# Altium schematic sheet 10_POWER_INPUT.SchDoc
size 297 x 209 mm
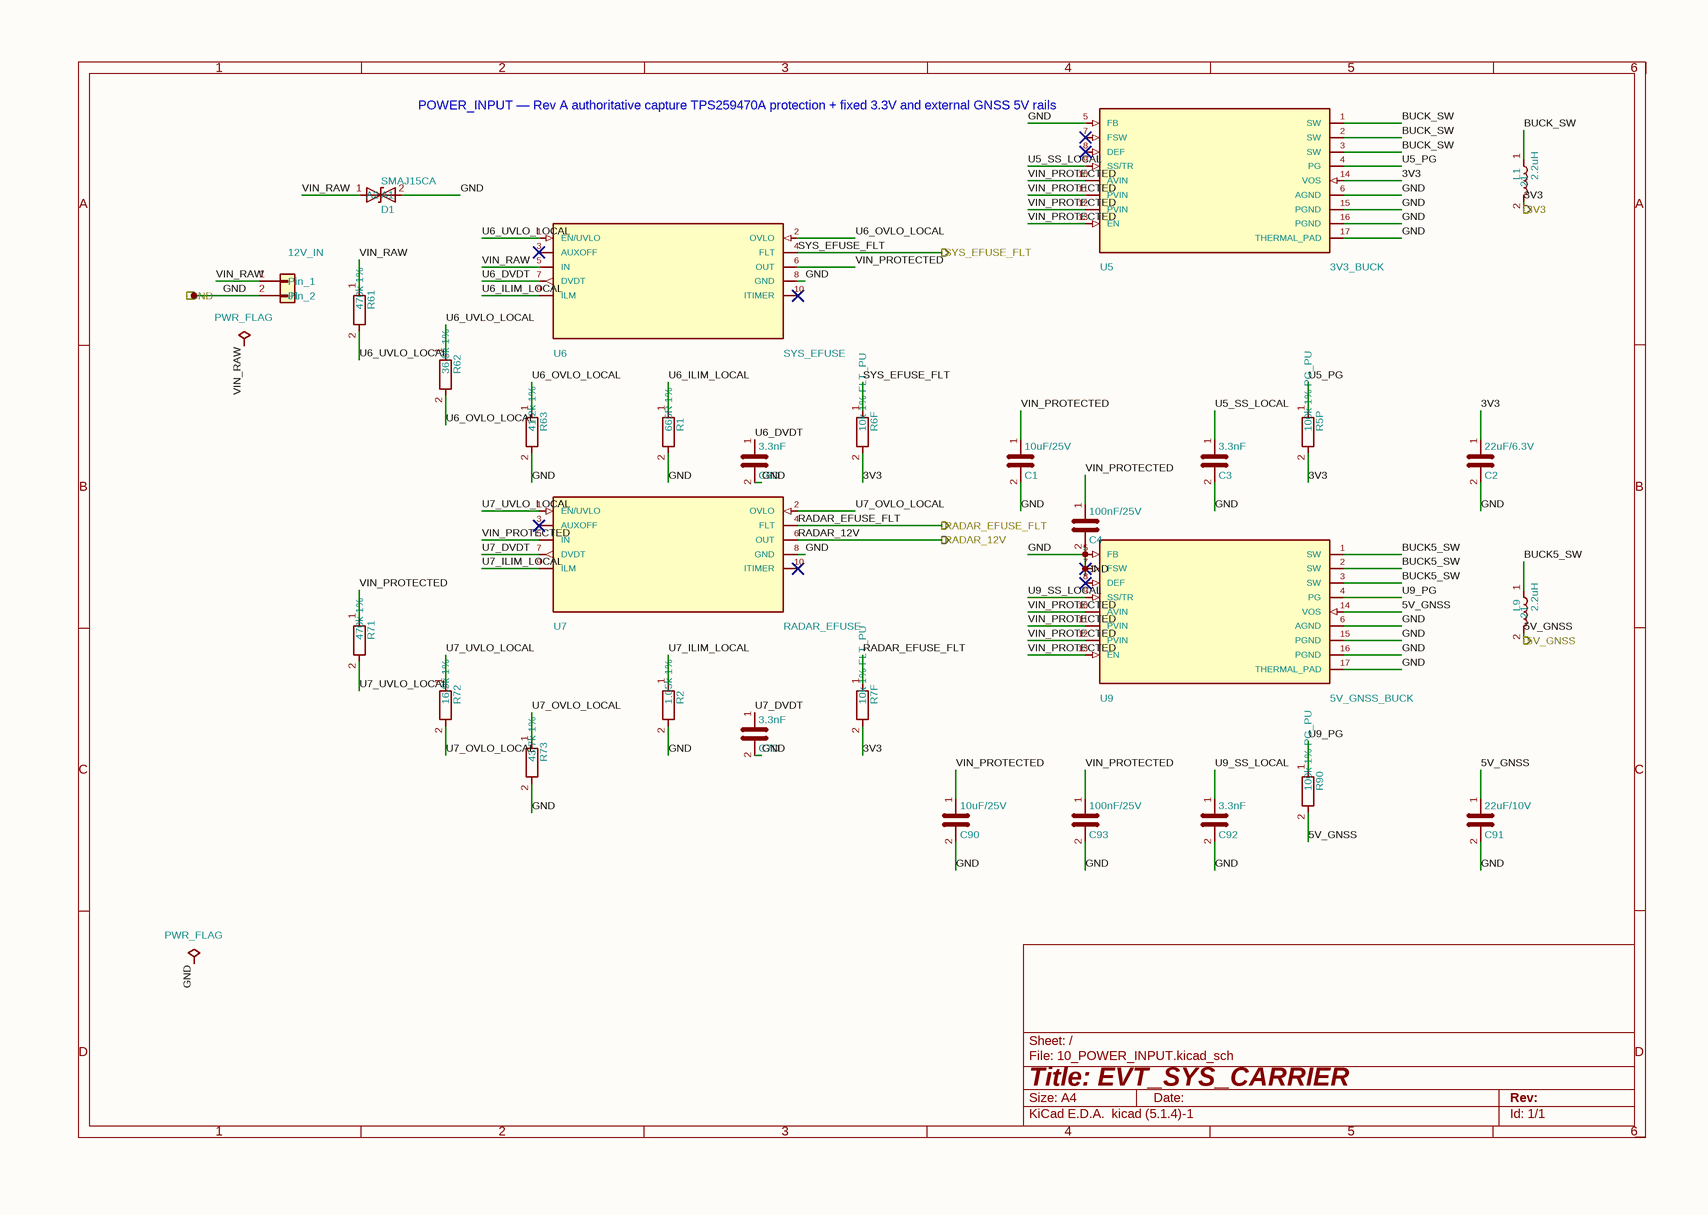
[diagram p0: 10_POWER_INPUT.SchDoc]

## Parts
#FLG0201  PWR_FLAG  (graphical)
#FLG0202  PWR_FLAG  (graphical)
C1  10uF/25V  [C_1206_3216Metric]
C2  22uF/6.3V  [C_1206_3216Metric]
C3  3.3nF  [C_0603_1608Metric]
C4  100nF/25V  [C_0603_1608Metric]
C6D  3.3nF  [C_0603_1608Metric]
C7D  3.3nF  [C_0603_1608Metric]
C90  10uF/25V  [C_1206_3216Metric]
C91  22uF/10V  [C_1206_3216Metric]
C92  3.3nF  [C_0603_1608Metric]
C93  100nF/25V  [C_0603_1608Metric]
D1  SMAJ15CA  [D_SMA]
J1  12V_IN  [Molex_43650-0200_RA_THT_2P]
L1  2.2uH  [Coilcraft_XFL4020_4x4]
L9  2.2uH  [Coilcraft_XFL4020_4x4]
R1  665R 1%  [R_0603_1608Metric]
R2  1.05k 1%  [R_0603_1608Metric]
R5P  100k 1% PG_PU  [R_0603_1608Metric]
R6F  10k 1% FLT_PU  [R_0603_1608Metric]
R7F  10k 1% FLT_PU  [R_0603_1608Metric]
R61  470k 1%  [R_0603_1608Metric]
R62  36.0k 1%  [R_0603_1608Metric]
R63  41.2k 1%  [R_0603_1608Metric]
R71  470k 1%  [R_0603_1608Metric]
R72  16.9k 1%  [R_0603_1608Metric]
R73  43.7k 1%  [R_0603_1608Metric]
R90  100k 1% PG_PU  [R_0603_1608Metric]
U5  3V3_BUCK  [VQFN-16-1EP_3x3mm_P0.5mm_EP1.68x1.68mm]
U6  SYS_EFUSE  [TPS259470A_RPW0010A_VQFN-HR-10_2x2mm_P0.475mm]
U7  RADAR_EFUSE  [TPS259470A_RPW0010A_VQFN-HR-10_2x2mm_P0.475mm]
U9  5V_GNSS_BUCK  [VQFN-16-1EP_3x3mm_P0.5mm_EP1.68x1.68mm]

## Ports
3V3 (out), 5V_GNSS (out), GND, RADAR_12V (out), RADAR_EFUSE_FLT (out), SYS_EFUSE_FLT (out)

## Nets
3V3: C2.1 L1.2 R5P.2 R6F.2 R7F.2 U5.14(VOS) ; port 3V3
5V_GNSS: C91.1 L9.2 R90.2 U9.14(VOS) ; port 5V_GNSS
BUCK5_SW: L9.1 U9.1(SW) U9.2(SW) U9.3(SW)
BUCK_SW: L1.1 U5.1(SW) U5.2(SW) U5.3(SW)
GND: #FLG0202.1 C1.2 C2.2 C3.2 C4.2 C6D.2 C7D.2 C90.2 C91.2 C92.2 C93.2 D1.2(A2) J1.2(Pin_2) R1.2 R2.2 R63.2 R73.2 U5.5(FB) U5.6(AGND) U5.15(PGND) U5.16(PGND) U5.17(THERMAL_PAD) U6.8(GND) U7.8(GND) U9.5(FB) U9.6(AGND) U9.7(FSW) U9.15(PGND) U9.16(PGND) U9.17(THERMAL_PAD) ; port GND
RADAR_12V: U7.6(OUT) ; port RADAR_12V
RADAR_EFUSE_FLT: R7F.1 U7.4(FLT) ; port RADAR_EFUSE_FLT
SYS_EFUSE_FLT: R6F.1 U6.4(FLT) ; port SYS_EFUSE_FLT
U5_PG: R5P.1 U5.4(PG)
U5_SS_LOCAL: C3.1 U5.9(SS/TR)
U6_DVDT: C6D.1 U6.7(DVDT)
U6_ILIM_LOCAL: R1.1 U6.9(ILM)
U6_OVLO_LOCAL: R62.2 R63.1 U6.2(OVLO)
U6_UVLO_LOCAL: R61.2 R62.1 U6.1(EN/UVLO)
U7_DVDT: C7D.1 U7.7(DVDT)
U7_ILIM_LOCAL: R2.1 U7.9(ILM)
U7_OVLO_LOCAL: R72.2 R73.1 U7.2(OVLO)
U7_UVLO_LOCAL: R71.2 R72.1 U7.1(EN/UVLO)
U9_PG: R90.1 U9.4(PG)
U9_SS_LOCAL: C92.1 U9.9(SS/TR)
VIN_PROTECTED: C1.1 C4.1 C90.1 C93.1 R71.1 U5.10(AVIN) U5.11(PVIN) U5.12(PVIN) U5.13(EN) U6.6(OUT) U7.5(IN) U9.10(AVIN) U9.11(PVIN) U9.12(PVIN) U9.13(EN)
VIN_RAW: #FLG0201.1 D1.1(A1) J1.1(Pin_1) R61.1 U6.5(IN)

Not connected (* = marked no-connect by the designer): U5 7(FSW)* 8(DEF)*; U6 3(AUXOFF)* 10(ITIMER)*; U7 3(AUXOFF)* 10(ITIMER)*; U9 8(DEF)*

## Notes on the sheet
- (near U5) POWER_INPUT — Rev A authoritative capture
  TPS259470A protection + fixed 3.3V and external GNSS 5V rails
- 1
- 2
- 3
- 4
- 5
- 6
- A
- B
- C
- D
- Title: EVT_SYS_CARRIER
- File: 10_POWER_INPUT.kicad_sch
- Sheet: /
- KiCad E.D.A.  kicad (5.1.4)-1
- Size: A4
- Date:
- Rev:
- Id: 1/1

## Library data of the parts
#FLG0201 #FLG0202 = PWR_FLAG: hierarchy_path: /9ce958f3-6019-45fe-bc02-0cccce48adf8/8ef865ad-b15f-47f6-9f00-bb693d917fe2; Value: PWR_FLAG
C1 C90 = C: MPN: 10uF_25V_X7R; hierarchy_path: /9ce958f3-6019-45fe-bc02-0cccce48adf8/8ef865ad-b15f-47f6-9f00-bb693d917fe2; Value: 10uF/25V; Footprint: Capacitor_SMD:C_1206_3216Metric
C2 = C: MPN: 22uF_6.3V_X7R; hierarchy_path: /9ce958f3-6019-45fe-bc02-0cccce48adf8/8ef865ad-b15f-47f6-9f00-bb693d917fe2; Value: 22uF/6.3V; Footprint: Capacitor_SMD:C_1206_3216Metric
C3 C6D C7D C92 = C: MPN: 3.3nF_X7R; hierarchy_path: /9ce958f3-6019-45fe-bc02-0cccce48adf8/8ef865ad-b15f-47f6-9f00-bb693d917fe2; Value: 3.3nF; Footprint: Capacitor_SMD:C_0603_1608Metric
C4 C93 = C: MPN: 100nF_25V_X7R; hierarchy_path: /9ce958f3-6019-45fe-bc02-0cccce48adf8/8ef865ad-b15f-47f6-9f00-bb693d917fe2; Value: 100nF/25V; Footprint: Capacitor_SMD:C_0603_1608Metric
C91 = C: MPN: 22uF_10V_X7R; hierarchy_path: /9ce958f3-6019-45fe-bc02-0cccce48adf8/8ef865ad-b15f-47f6-9f00-bb693d917fe2; Value: 22uF/10V; Footprint: Capacitor_SMD:C_1206_3216Metric
D1 = D_TVS: hierarchy_path: /9ce958f3-6019-45fe-bc02-0cccce48adf8/8ef865ad-b15f-47f6-9f00-bb693d917fe2; MPN: SMAJ15CA; Value: SMAJ15CA; Footprint: Diode_SMD:D_SMA
J1 = Conn_01x02: MPN: 43650-0200; hierarchy_path: /9ce958f3-6019-45fe-bc02-0cccce48adf8/8ef865ad-b15f-47f6-9f00-bb693d917fe2; Value: 12V_IN; Footprint: SystemCarrier_Altium:Molex_43650-0200_RA_THT_2P
L1 L9 = L: MPN: XFL4020-222MEC; hierarchy_path: /9ce958f3-6019-45fe-bc02-0cccce48adf8/8ef865ad-b15f-47f6-9f00-bb693d917fe2; Value: 2.2uH; Footprint: SystemCarrier_Altium:Coilcraft_XFL4020_4x4
R1 = R: MPN: 665R_1%; hierarchy_path: /9ce958f3-6019-45fe-bc02-0cccce48adf8/8ef865ad-b15f-47f6-9f00-bb693d917fe2; Value: 665R 1%; Footprint: Resistor_SMD:R_0603_1608Metric
R2 = R: MPN: 1.05k_1%; hierarchy_path: /9ce958f3-6019-45fe-bc02-0cccce48adf8/8ef865ad-b15f-47f6-9f00-bb693d917fe2; Value: 1.05k 1%; Footprint: Resistor_SMD:R_0603_1608Metric
R5P R90 = R: MPN: 100k_1%; hierarchy_path: /9ce958f3-6019-45fe-bc02-0cccce48adf8/8ef865ad-b15f-47f6-9f00-bb693d917fe2; Value: 100k 1% PG_PU; Footprint: Resistor_SMD:R_0603_1608Metric
R6F R7F = R: MPN: 10k_1%; hierarchy_path: /9ce958f3-6019-45fe-bc02-0cccce48adf8/8ef865ad-b15f-47f6-9f00-bb693d917fe2; Value: 10k 1% FLT_PU; Footprint: Resistor_SMD:R_0603_1608Metric
R61 R71 = R: MPN: 470k_1%; hierarchy_path: /9ce958f3-6019-45fe-bc02-0cccce48adf8/8ef865ad-b15f-47f6-9f00-bb693d917fe2; Value: 470k 1%; Footprint: Resistor_SMD:R_0603_1608Metric
R62 = R: MPN: 36.0k_1%; hierarchy_path: /9ce958f3-6019-45fe-bc02-0cccce48adf8/8ef865ad-b15f-47f6-9f00-bb693d917fe2; Value: 36.0k 1%; Footprint: Resistor_SMD:R_0603_1608Metric
R63 = R: MPN: 41.2k_1%; hierarchy_path: /9ce958f3-6019-45fe-bc02-0cccce48adf8/8ef865ad-b15f-47f6-9f00-bb693d917fe2; Value: 41.2k 1%; Footprint: Resistor_SMD:R_0603_1608Metric
R72 = R: MPN: 16.9k_1%; hierarchy_path: /9ce958f3-6019-45fe-bc02-0cccce48adf8/8ef865ad-b15f-47f6-9f00-bb693d917fe2; Value: 16.9k 1%; Footprint: Resistor_SMD:R_0603_1608Metric
R73 = R: MPN: 43.7k_1%; hierarchy_path: /9ce958f3-6019-45fe-bc02-0cccce48adf8/8ef865ad-b15f-47f6-9f00-bb693d917fe2; Value: 43.7k 1%; Footprint: Resistor_SMD:R_0603_1608Metric
U5 = TPS62132RGTR: Capture_Status: LOCAL_CONTRACT_SYMBOL; hierarchy_path: /9ce958f3-6019-45fe-bc02-0cccce48adf8/8ef865ad-b15f-47f6-9f00-bb693d917fe2; MPN: TPS62132RGTR; Value: 3V3_BUCK; Footprint: Package_DFN_QFN:VQFN-16-1EP_3x3mm_P0.5mm_EP1.68x1.68mm
U6 U7 = TPS259470ARPWR: Capture_Status: LOCAL_CONTRACT_SYMBOL; hierarchy_path: /9ce958f3-6019-45fe-bc02-0cccce48adf8/8ef865ad-b15f-47f6-9f00-bb693d917fe2; MPN: TPS259470ARPWR; Footprint: SystemCarrier_Local:TPS259470A_RPW0010A_VQFN-HR-10_2x2mm_P0.475mm
  U6: Value: SYS_EFUSE
  U7: Value: RADAR_EFUSE
U9 = TPS62133RGTR: Capture_Status: LOCAL_CONTRACT_SYMBOL; hierarchy_path: /9ce958f3-6019-45fe-bc02-0cccce48adf8/8ef865ad-b15f-47f6-9f00-bb693d917fe2; MPN: TPS62133RGTR; Value: 5V_GNSS_BUCK; Footprint: Package_DFN_QFN:VQFN-16-1EP_3x3mm_P0.5mm_EP1.68x1.68mm